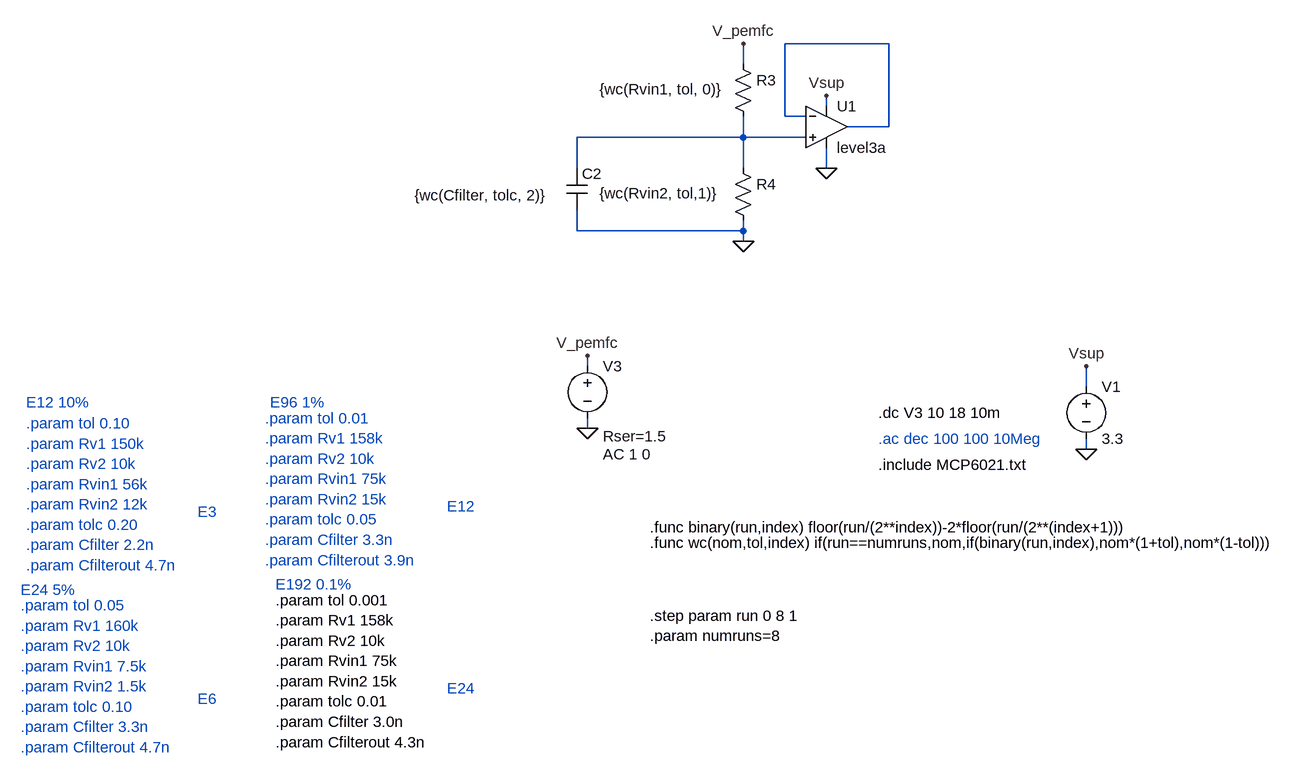
[diagram p0: schematic voltage_sense_input.asc]
voltage_sense_input.asc, the LTspice schematic file:
Version 4.1
SHEET 1 1300 1128
WIRE 304 -64 144 -64
WIRE 80 -32 80 -64
WIRE 208 32 208 16
WIRE 144 48 144 -64
WIRE 176 48 144 48
WIRE 304 64 304 -64
WIRE 304 64 240 64
WIRE 80 80 80 48
WIRE 80 80 -176 80
WIRE 176 80 80 80
WIRE -176 128 -176 80
WIRE 80 128 80 80
WIRE 208 128 208 96
WIRE -176 224 -176 192
WIRE 80 224 80 208
WIRE 80 224 -176 224
WIRE 80 240 80 224
WIRE -160 432 -160 416
WIRE 608 464 608 432
WIRE -160 528 -160 512
WIRE 608 560 608 544
FLAG 608 560 0
FLAG 608 432 Vsup
FLAG 208 128 0
FLAG 208 16 Vsup
FLAG 80 -64 V_pemfc
FLAG 80 240 0
FLAG -160 528 0
FLAG -160 416 V_pemfc
SYMBOL voltage 608 448 R0
WINDOW 123 0 0 Left 0
WINDOW 39 0 0 Left 0
SYMATTR InstName V1
SYMATTR Value 3.3
SYMBOL res 64 -48 R0
WINDOW 3 -205 54 Left 2
SYMATTR Value {wc(Rvin1, tol, 0)}
SYMATTR InstName R3
SYMBOL res 64 112 R0
WINDOW 3 -205 54 Left 2
SYMATTR Value {wc(Rvin2, tol,1)}
SYMATTR InstName R4
SYMBOL OpAmps\\UniversalOpAmp3 208 64 R0
SYMATTR InstName U1
SYMBOL voltage -160 416 R0
WINDOW 3 32 51 Left 2
WINDOW 123 24 152 Left 2
WINDOW 39 24 124 Left 2
SYMATTR Value ""
SYMATTR Value2 AC 1 0
SYMATTR SpiceLine Rser=1.5
SYMATTR InstName V3
SYMBOL cap -192 128 R0
WINDOW 3 -234 41 Left 2
SYMATTR Value {wc(Cfilter, tolc, 2)}
SYMATTR InstName C2
TEXT 288 584 Left 2 !.include MCP6021.txt
TEXT -64 704 Left 2 !.func wc(nom,tol,index) if(run==numruns,nom,if(binary(run,index),nom*(1+tol),nom*(1-tol)))
TEXT -64 680 Left 2 !.func binary(run,index) floor(run/(2**index))-2*floor(run/(2**(index+1)))
TEXT -1024 488 Left 2 ;E12 10%
TEXT -1032 776 Left 2 ;E24 5%
TEXT -648 488 Left 2 ;E96 1%
TEXT -640 768 Left 2 ;E192 0.1%
TEXT -64 816 Left 2 !.step param run 0 8 1\n.param numruns=8
TEXT -1024 520 Left 2 ;.param tol 0.10\n.param Rv1 150k\n.param Rv2 10k\n.param Rvin1 56k\n.param Rvin2 12k\n.param tolc 0.20\n.param Cfilter 2.2n\n.param Cfilterout 4.7n
TEXT -1032 800 Left 2 ;.param tol 0.05\n.param Rv1 160k\n.param Rv2 10k\n.param Rvin1 7.5k\n.param Rvin2 1.5k\n.param tolc 0.10\n.param Cfilter 3.3n\n.param Cfilterout 4.7n
TEXT -656 512 Left 2 ;.param tol 0.01\n.param Rv1 158k\n.param Rv2 10k\n.param Rvin1 75k\n.param Rvin2 15k\n.param tolc 0.05\n.param Cfilter 3.3n\n.param Cfilterout 3.9n
TEXT -640 792 Left 2 !.param tol 0.001\n.param Rv1 158k\n.param Rv2 10k\n.param Rvin1 75k\n.param Rvin2 15k\n.param tolc 0.01\n.param Cfilter 3.0n\n.param Cfilterout 4.3n
TEXT 288 504 Left 2 !.dc V3 10 18 10m
TEXT 288 544 Left 2 ;.ac dec 100 100 10Meg
TEXT -376 928 Left 2 ;E24
TEXT -760 944 Left 2 ;E6
TEXT -376 648 Left 2 ;E12
TEXT -760 656 Left 2 ;E3

The netlist it stands for:
* voltage_sense_input.asc
V1 Vsup 0 3.3
R3 V_pemfc N002 {wc(Rvin1, tol, 0)}
R4 N002 0 {wc(Rvin2, tol,1)}
X§U1 N002 N001 Vsup 0 N001 level3a  ; pins In+ In- V+ V- OUT
V3 V_pemfc 0 AC 1 0 Rser=1.5
C2 N002 0 {wc(Cfilter, tolc, 2)}
.include MCP6021.txt
.func wc(nom,tol,index) if(run==numruns,nom,if(binary(run,index),nom*(1+tol),nom*(1-tol)))
.func binary(run,index) floor(run/(2**index))-2*floor(run/(2**(index+1)))
* E12 10%
* E24 5%
* E96 1%
* E192 0.1%
.step param run 0 8 1
.param numruns=8
* .param tol 0.10
* .param Rv1 150k
* .param Rv2 10k
* .param Rvin1 56k
* .param Rvin2 12k
* .param tolc 0.20
* .param Cfilter 2.2n
* .param Cfilterout 4.7n
* .param tol 0.05
* .param Rv1 160k
* .param Rv2 10k
* .param Rvin1 7.5k
* .param Rvin2 1.5k
* .param tolc 0.10
* .param Cfilter 3.3n
* .param Cfilterout 4.7n
* .param tol 0.01
* .param Rv1 158k
* .param Rv2 10k
* .param Rvin1 75k
* .param Rvin2 15k
* .param tolc 0.05
* .param Cfilter 3.3n
* .param Cfilterout 3.9n
.param tol 0.001
.param Rv1 158k
.param Rv2 10k
.param Rvin1 75k
.param Rvin2 15k
.param tolc 0.01
.param Cfilter 3.0n
.param Cfilterout 4.3n
.dc V3 10 18 10m
* .ac dec 100 100 10Meg
* E24
* E6
* E12
* E3
.backanno
.end